# Altium schematic sheet k20-C-3.SchDoc
size A3; SheetNumber: 1; SheetTotal: 1
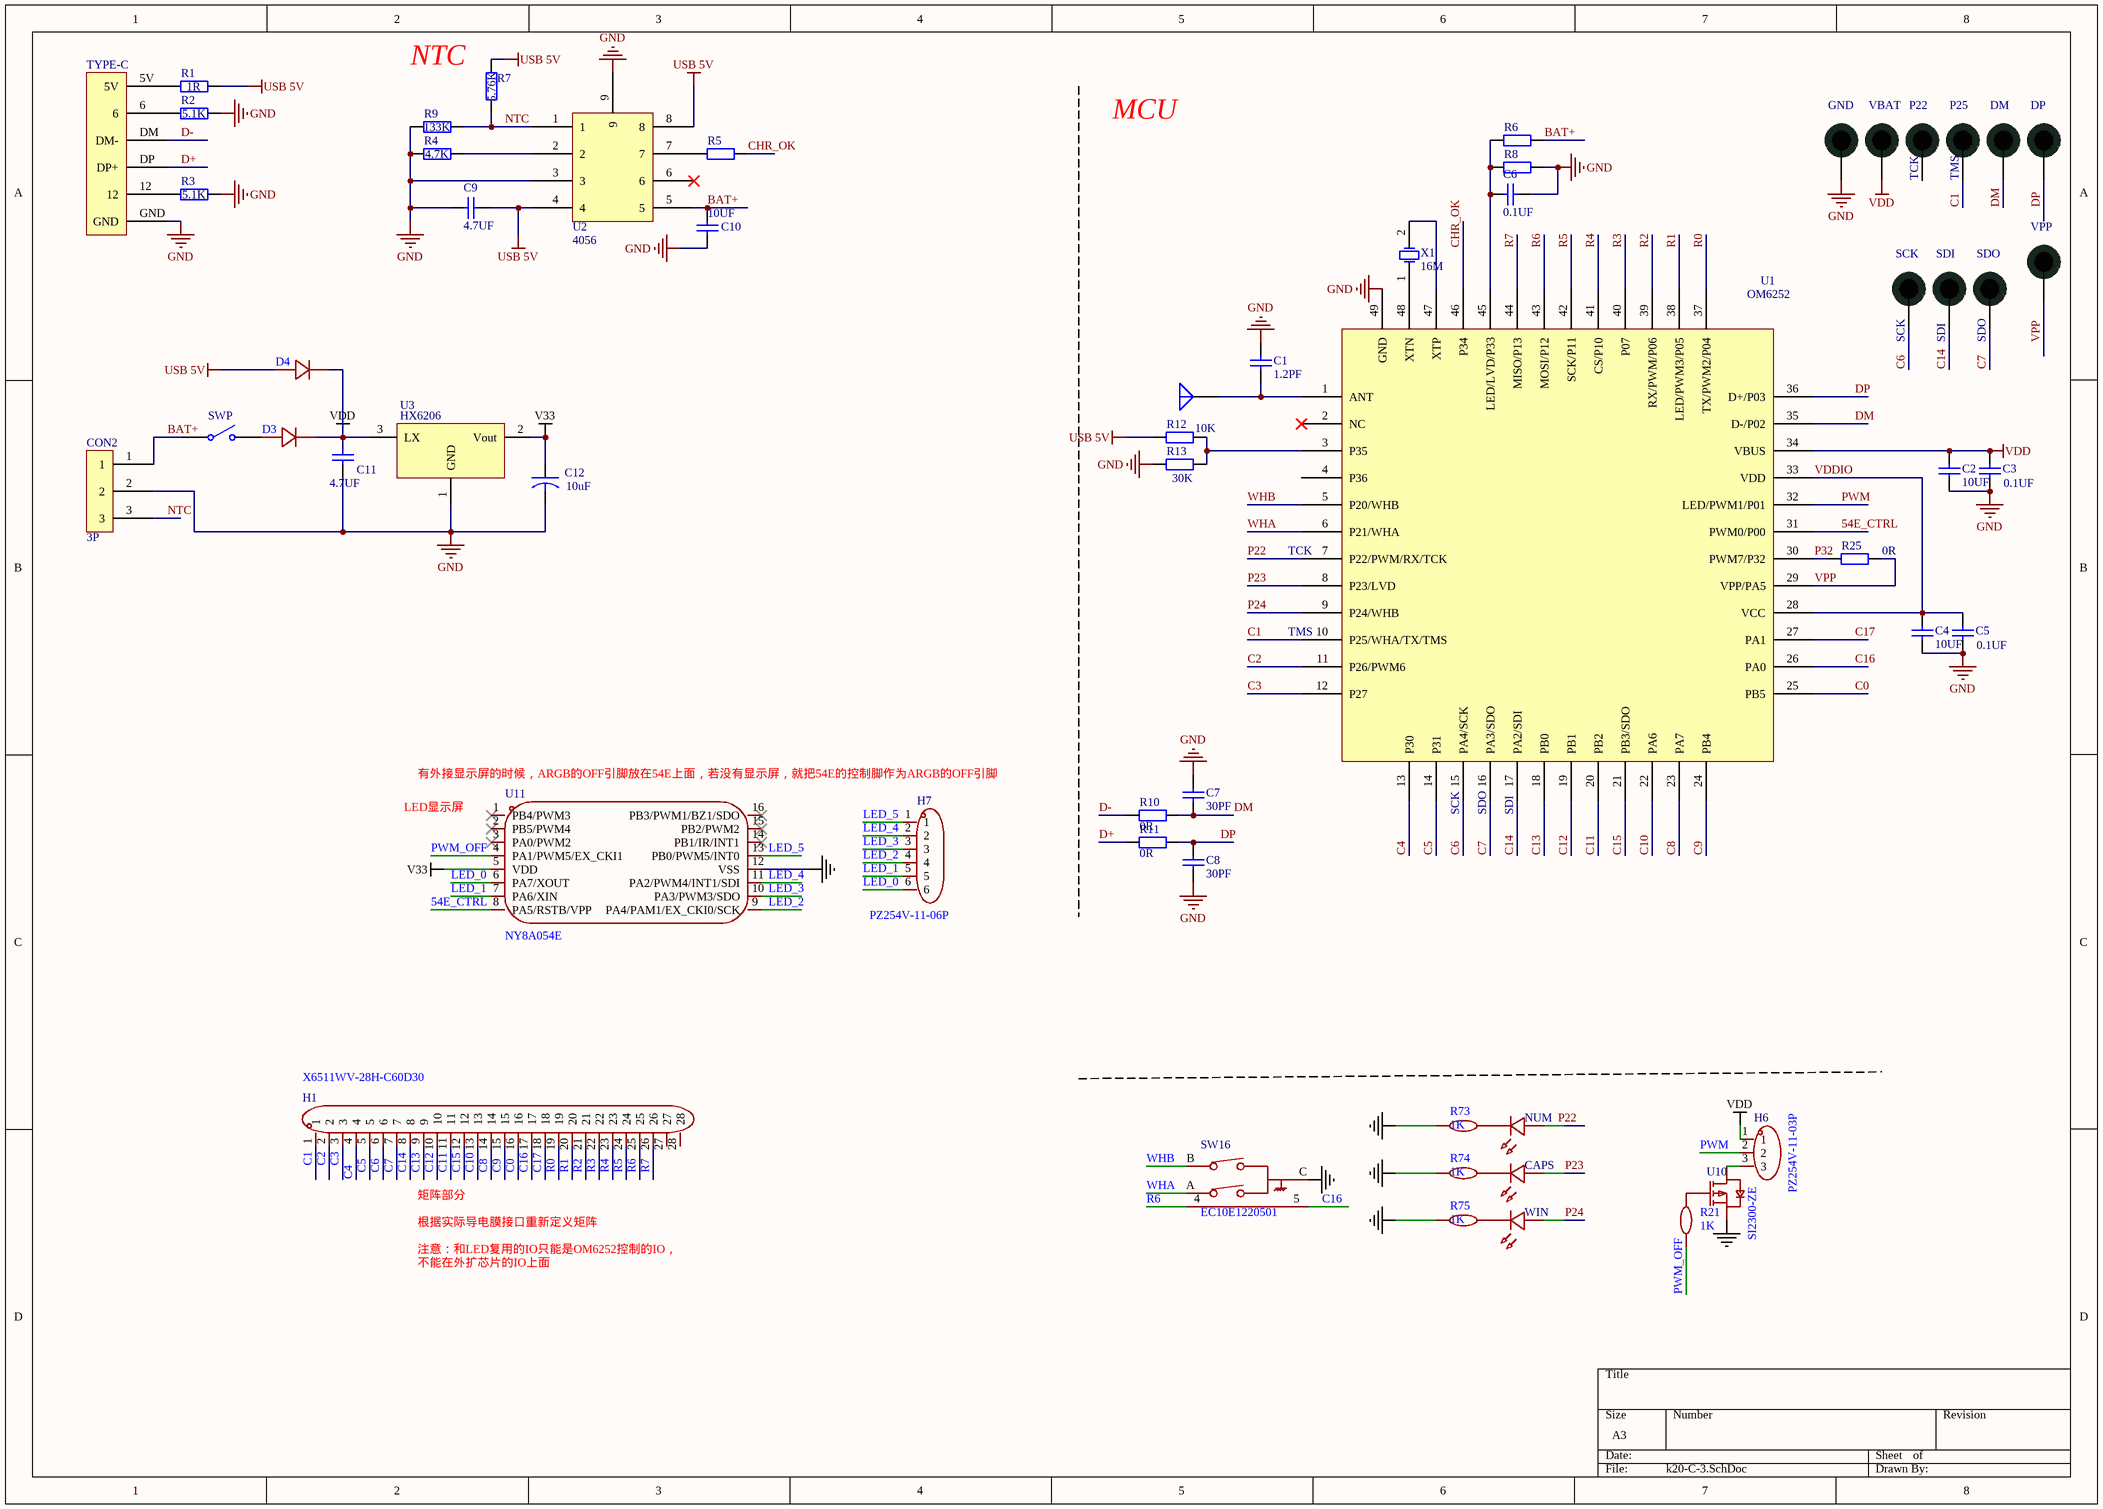
[diagram p0: k20-C-3.SchDoc]

## Parts
?  (no value)  [ANT_F_S]
C1  1.2PF  [C0402]
C2  10UF  [C0603]
C3  0.1UF  [C0402]
C4  10UF  [C0603]
C5  0.1UF  [C0402]
C6  0.1UF  [C0402]
C7  30PF  [C0402]
C8  30PF  [C0402]
C9  4.7UF  [C0402]
C10  10UF  [C0603]
C11  4.7UF  [C0402]
C12  10uF  [C0603]
CAPS  (no value)  [LED_0603G]
CON2  3P  [3P_1.25W_SMD]
D3  (no value)  [SOD-323(5819)]
D4  (no value)  [SOD-323(5819)]
DM  (no value)  [TEST]
DP  (no value)  [TEST]
GND  (no value)  [TEST]
H1  X6511WV-28H-C60D30  [FPC_26P_1.0]
H6  PZ254V-11-03P  [3P_1.25W_SMD]
H7  PZ254V-11-06P  [SMG-6P]
NUM  (no value)  [LED_0603G]
P22  (no value)  [TEST]
P25  (no value)  [TEST]
R1  1R  [R0603]
R2  5.1K  [R0402]
R3  5.1K  [R0402]
R4  4.7K  [R0402]
R5  0R  [R0402]  (value not drawn)
R6  2M  [R0402]  (value not drawn)
R7  value 5.76K  [R0402]  (hidden comment: 5.75K)
R8  1M  [R0402]  (value not drawn)
R9  133K  [R0402]
R10  0R  [R0402]
R11  0R  [R0402]
R12  10K  [R0402]
R13  30K  [R0402]
R21  1K  [R0402]
R25  0R  [R0402]
R73  1K  [R0402]
R74  1K  [R0402]
R75  1K  [R0402]
SCK  (no value)  [TEST]
SDI  (no value)  [TEST]
SDO  (no value)  [TEST]
SW16  EC10E1220501  [EC11]
SWP  (no value)  [SW_SMD_7]
TYPE-C  (no value)  [TYPE_C_16]
U1  OM6252  [QFN48_6*6]
U2  4056  [SOP_8_D]
U3  HX6206  [SOT_23]
U10  SI2300-ZE  [SOT_23_NPN]
U11  NY8A054E  [SOP16]
VBAT  (no value)  [TEST]
VPP  (no value)  [TEST]
WIN  (no value)  [LED_0603R]
X1  16M  [CRYSTAL-SMD3225-4P]

## Nets
GND: C1.2 C2.2 C3.2 C4.2 C5.2 C6.1 C7.1 C8.2 C9.2 C10.2 C11.1 C12.2 CON2.2 GND.1 R2.1 R3.1 R4.1 R8.2 R9.2 R13.1 R73.2 R74.2 R75.2 SW16.C TYPE-C.GND U1.49(GND) U2.3 U2.9 U3.1(GND) U10.2(S)
USB 5V: C9.1 D4.2(A) R1.1 R7.1 R12.1 U2.4 U2.8
V33: C12.1 U3.2(Vout) U11.5(VDD)
VDD: C2.1 C3.1 C11.2 D3.1(K) D4.1(K) H6.1 U1.34(VBUS) U3.3(LX) VBAT.1
54E_CTRL: U1.31(PWM0/P00) U11.8(PA5/RSTB/VPP)
BAT+: C10.1 CON2.1 R6.2 SWP.1(COMMON) U2.5
C0: H1.16 U1.25(PB5)
C1: H1.1 P25.1 U1.10(P25/WHA/TX/TMS)
C2: H1.2 U1.11(P26/PWM6)
C3: H1.3 U1.12(P27)
C4: H1.4 U1.13(P30)
C5: H1.5 U1.14(P31)
C6: H1.6 SCK.1 U1.15(PA4/SCK)
C7: H1.7 SDO.1 U1.16(PA3/SDO)
C8: H1.14 U1.23(PA7)
C9: H1.15 U1.24(PB4)
C10: H1.13 U1.22(PA6)
C11: H1.11 U1.20(PB2)
C12: H1.10 U1.19(PB1)
C13: H1.9 U1.18(PB0)
C14: H1.8 SDI.1 U1.17(PA2/SDI)
C15: H1.12 U1.21(PB3/SDO)
C16: H1.17 SW16.5 U1.26(PA0)
C17: H1.18 U1.27(PA1)
CHR_OK: R5.2 U1.46(P34)
D+: R11.2 TYPE-C.DP(DP+)
D-: R10.2 TYPE-C.DM(DM-)
DM: C7.2 DM.1 R10.1 U1.35(D-/P02)
DP: C8.1 DP.1 R11.1 U1.36(D+/P03)
LED_0: H7.6 U11.6(PA7/XOUT)
LED_1: H7.5 U11.7(PA6/XIN)
LED_2: H7.4 U11.9(PA4/PAM1/EX_CKI0/SCK)
LED_3: H7.3 U11.10(PA3/PWM3/SDO)
LED_4: H7.2 U11.11(PA2/PWM4/INT1/SDI)
LED_5: H7.1 U11.13(PB0/PWM5/INT0)
NTC: CON2.3 R7.2 R9.1 U2.1
P22: NUM.2(A) U1.7(P22/PWM/RX/TCK)
P23: CAPS.2(A) U1.8(P23/LVD)
P24: U1.9(P24/WHB) WIN.2(A)
P32: R25.2 U1.30(PWM7/P32)
PWM: H6.2 U1.32(LED/PWM1/P01)
PWM_OFF: R21.1 U11.4(PA1/PWM5/EX_CKI1)
R0: H1.19 U1.37(TX/PWM2/P04)
R1: H1.20 U1.38(LED/PWM3/P05)
R2: H1.21 U1.39(RX/PWM/P06)
R3: H1.22 U1.40(P07)
R4: H1.23 U1.41(CS/P10)
R5: H1.24 U1.42(SCK/P11)
R6: H1.25 SW16.4 U1.43(MOSI/P12)
R7: H1.26 U1.44(MISO/P13)
VDDIO: C4.1 C5.1 U1.28(VCC) U1.33(VDD)
VPP: R25.1 U1.29(VPP/PA5) VPP.1
WHA: SW16.A U1.6(P21/WHA)
WHB: SW16.B U1.5(P20/WHB)
Net?_1: ?.1(A) C1.1 U1.1(ANT)
NetC6_2: C6.2 R6.1 R8.1 U1.45(LED/LVD/P33)
NetCAPS_1: CAPS.1(C) R74.1
NetD3_2: D3.2(A) SWP.2(NO)
NetH6_3: H6.3 U10.3(D)
NetNUM_1: NUM.1(C) R73.1
NetR1_2: R1.2 TYPE-C.5V
NetR2_2: R2.2 TYPE-C.6
NetR3_2: R3.2 TYPE-C.12
NetR4_2: R4.2 U2.2
NetR5_1: R5.1 U2.7
NetR12_2: R12.2 R13.2 U1.3(P35)
NetR21_2: R21.2 U10.1(G)
NetR75_1: R75.1 WIN.1(C)
NetU1_47: U1.47(XTP) X1.2(OSC2)
NetU1_48: U1.48(XTN) X1.1(OSC1)

Not connected (* = marked no-connect by the designer): H1 27 28; P22 1; U1 2(NC)* 4(P36); U2 6*; U11 1(PB4/PWM3)* 2(PB5/PWM4)* 3(PA0/PWM2)* 12(VSS) 14(PB1/IR/INT1)* 15(PB2/PWM2)* 16(PB3/PWM1/BZ1/SDO)*

## Notes on the sheet
- NTC
- MCU
- TCK
- TMS
- SCK
- SDI
- SDO
- (near U1) TCK
- (near U1) TMS
- (near U11) 有外接显示屏的时候，ARGB的OFF引脚放在54E上面，若没有显示屏，就把54E的控制脚作为ARGB的OFF引脚
- LED显示屏
- (near U1) SCK
- (near U1) SDO
- (near U1) SDI
- 矩阵部分
  根据实际导电膜接口重新定义矩阵
  注意：和LED复用的IO只能是OM6252控制的IO，
  不能在外扩芯片的IO上面

## Library data of the parts
? = Antenna: Generic Antenna; Published: 24-Mar-1999; LatestRevisionDate: 17-Jul-2002; LatestRevisionNote: Re-released for DXP Platform.; PackageReference: PIN1; Publisher: Altium Limited
C1-C11 = Cap: Capacitor; Published: 8-Jun-2000; LatestRevisionDate: 17-Jul-2002; LatestRevisionNote: Re-released for DXP Platform.; PackageReference: RAD-0.3; Publisher: Altium Limited; PackageDescription: Radial Cap, Thru-Hole; 2 Leads; 0.3 in Pin Spacing
  C2 C4: Value: 10UF
  C11: Value: 4.7UF
C12 = CAPACITOR
CAPS NUM WIN = LED_0603-R: Symbol: LED_R; Convert to PCB: yes; Device: LED_0603-R; Add into BOM: yes; Supplier Footprint: 0603
D3 D4 = D_1N4007A: Add into BOM: yes; Symbol: D_1N4007; Device: D_1N4007A; Supplier Footprint: DO-41; Convert to PCB: yes
DM DP GND P22 P25 SCK SDI SDO VBAT VPP = TEST_POINT
H1 = X6511WV-28H-C60D30: Manufacturer: XKB Connection(中国星坤); Symbol: X6511WV-28H-C30D60; Add into BOM: yes; Pin Structure: 1x28P; Pitch: 2.54mm; Circluar Pins/Square Pins: 方针; Current Rating (Max): 3A; Voltage Rating (Max): 250V; Soldering Temperature(Max): 260℃; Device: X6511WV-28H-C60D30; LCSC Part Name: 1x28P 间距:2.54mm 方针; Supplier Part: C725960; Manufacturer Part: X6511WV-28H-C60D30; Supplier Footprint: 插件,P=2.54mm; JLCPCB Part Class: Extended Part; Supplier: LCSC; Convert to PCB: yes; Row Spacing: 2.54mm; Mounting Type: -; Number of Rows: 单排; Number of Pins: 28P; Length of Mating Pin: -; Insulation Height: 2.5mm; Length of End Connection Pin: -; Contact Material: 黄铜; Contact Plating: 金; Operating Temperature Range: -40℃~+105℃; Color: 黑色
H6 = PZ254V-11-03P: Manufacturer: XFCN(兴飞); Symbol: PZ254V-11-03P_C2937625; Add into BOM: yes; Pin Structure: 1x3P; Pitch: 2.54mm; Circluar Pins/Square Pins: 方针; Current Rating (Max): 3A; Voltage Rating (Max): 250V; Device: PZ254V-11-03P; LCSC Part Name: 间距:2.54mm 1x3P 直插 方针; Supplier Part: C2937625; Manufacturer Part: PZ254V-11-03P; Supplier Footprint: 插件,P=2.54mm; JLCPCB Part Class: Extended Part; Datasheet: https://atta.szlcsc.com/upload/public/pdf/source/20200309/C492402_8335C3D49C4E4C618838D59BB1D024C1.pdf; Supplier: LCSC; Convert to PCB: yes; Row Spacing: -; Mounting Type: 直插; Number of Rows: 单排; Number of Pins: 3P; Length of Mating Pin: 6mm; Insulation Height: 2.5mm; Length of End Connection Pin: 3mm; Operating Temperature Range: -40℃~+105℃; Color: 黑色
H7 = PZ254V-11-06P: Manufacturer: XFCN(兴飞); Add into BOM: yes; Pin Structure: 1x6P; Pitch: 2.54mm; Circluar Pins/Square Pins: 方针; Symbol: PZ254V-11-06P; Device: PZ254V-11-06P; LCSC Part Name: 间距:2.54mm 1x6P 直插 方针; Supplier Part: C492405; Manufacturer Part: PZ254V-11-06P; Supplier Footprint: 插件,P=2.54mm; JLCPCB Part Class: Extended Part; Datasheet: https://atta.szlcsc.com/upload/public/pdf/source/20200309/C492405_597F1930F5B55CC3C7FD95458F1C3977.pdf; Supplier: LCSC; Convert to PCB: yes; Row Spacing: -; Mounting Type: 直插; Number of Rows: 单排; Number of Pins: 6P; Current Rating (Max): -; Voltage Rating (Max): -; Length of Mating Pin: 6mm; Insulation Height: 2.5mm; Length of End Connection Pin: 3mm; Contact Material: 黄铜; Contact Plating: -; Operating Temperature Range: -40℃~+105℃; Color: 黑色
R1-R13 R25 = Res2: Resistor; Published: 8-Jun-2000; LatestRevisionDate: 17-Jul-2002; LatestRevisionNote: Re-released for DXP Platform.; PackageReference: AXIAL-0.4; Publisher: Altium Limited; PackageDescription: Axial Device, Thru-Hole; 2 Leads; 0.4 in Pin Spacing
  R9: Value: 133K
R21 R73-R75 = Res_0603: Symbol: 电阻; Convert to PCB: yes; Device: Res_0603; Add into BOM: yes; Supplier Footprint: 0603; Value: 1K
SW16 = EC10E1220501: Manufacturer: ALPSALPINE(阿尔卑斯阿尔派); Add into BOM: yes; Symbol: EC10E1220501; Device: EC10E1220501; LCSC Part Name: EC10E1220501; Supplier Part: C160889; Manufacturer Part: EC10E1220501; Supplier Footprint: 插件; JLCPCB Part Class: Extended Part; Datasheet: https://atta.szlcsc.com/upload/public/pdf/source/20180227/C160889_15197014267581370273.pdf; Supplier: LCSC; Convert to PCB: yes
SWP = SW-SPST: Single-Pole, Single-Throw Switch; Published: 24-Mar-1999; LatestRevisionDate: 17-Jul-2002; LatestRevisionNote: Re-released for DXP Platform.; PackageReference: SPST-2; Publisher: Altium Limited; PackageDescription: Switch; 2 Leads
TYPE-C = USB 16Pin
U1 = QFN48-BYC6625
U2 = 4057 SOP-8
U3 = BL8530
U10 = SI2301-ZE: Manufacturer: HXY MOSFET(华轩阳电子); Add into BOM: yes; Drain Source Voltage (Vdss): 20V; Continuous Drain Current (Id): 2.3A; Power Dissipation (Pd): 700mW; Drain Source On Resistance (RDS(on)@Vgs,Id): 126mΩ@4.5V; Gate Threshold Voltage (Vgs(th)@Id): 1V@250uA; Input Capacitance (Ciss@Vds): 285pF; Symbol: SI2301-ZE; Device: SI2301-ZE; LCSC Part Name: 1个P沟道 耐压:20V 电流:2.3A; Supplier Part: C5261052; Manufacturer Part: SI2300-ZE; Supplier Footprint: SOT-23; JLCPCB Part Class: Extended Part; Datasheet: https://atta.szlcsc.com/upload/public/pdf/source/20230515/2FF2907841563ED329594D3237822724.pdf; Supplier: LCSC; Convert to PCB: yes; Type: 1个P沟道
U11 = NY8A054E_C5143691: Manufacturer: 九齐; Add into BOM: yes; Symbol: NY8A054E_C5143691; Device: NY8A054E_C5143691; LCSC Part Name: NY8A054E; Supplier Part: C5143691; Manufacturer Part: NY8A054E; Supplier Footprint: SOP-16; JLCPCB Part Class: Extended Part; Datasheet: https://atta.szlcsc.com/upload/public/pdf/source/20220901/9859F0BC82D614E1FA05D663ED00CF5E.pdf; Supplier: LCSC; Convert to PCB: yes
X1 = XTAL: Crystal Oscillator; Published: 8-Jun-2000; LatestRevisionDate: 17-Jul-2002; LatestRevisionNote: Re-released for DXP Platform.; PackageReference: R38; Publisher: Altium Limited; PackageDescription: Crystal, Thru-Hole; 2 Leads; Body 3.1 x 8.2 mm (Dia.xH)